# EasyEDA Pro project 51-mcu-core-board.epro

# Schematic 51单片机核心板原理图
Board Name: 51单片机核心板; Create Date: 2025-06-16; Page Name: P1; Project Name: 51单片机核心板; Schematic Name: 51单片机核心板原理图; Update Date: 2025-06-17; Company: 嘉立创EDA; Page Size: A4; Version: V1.0
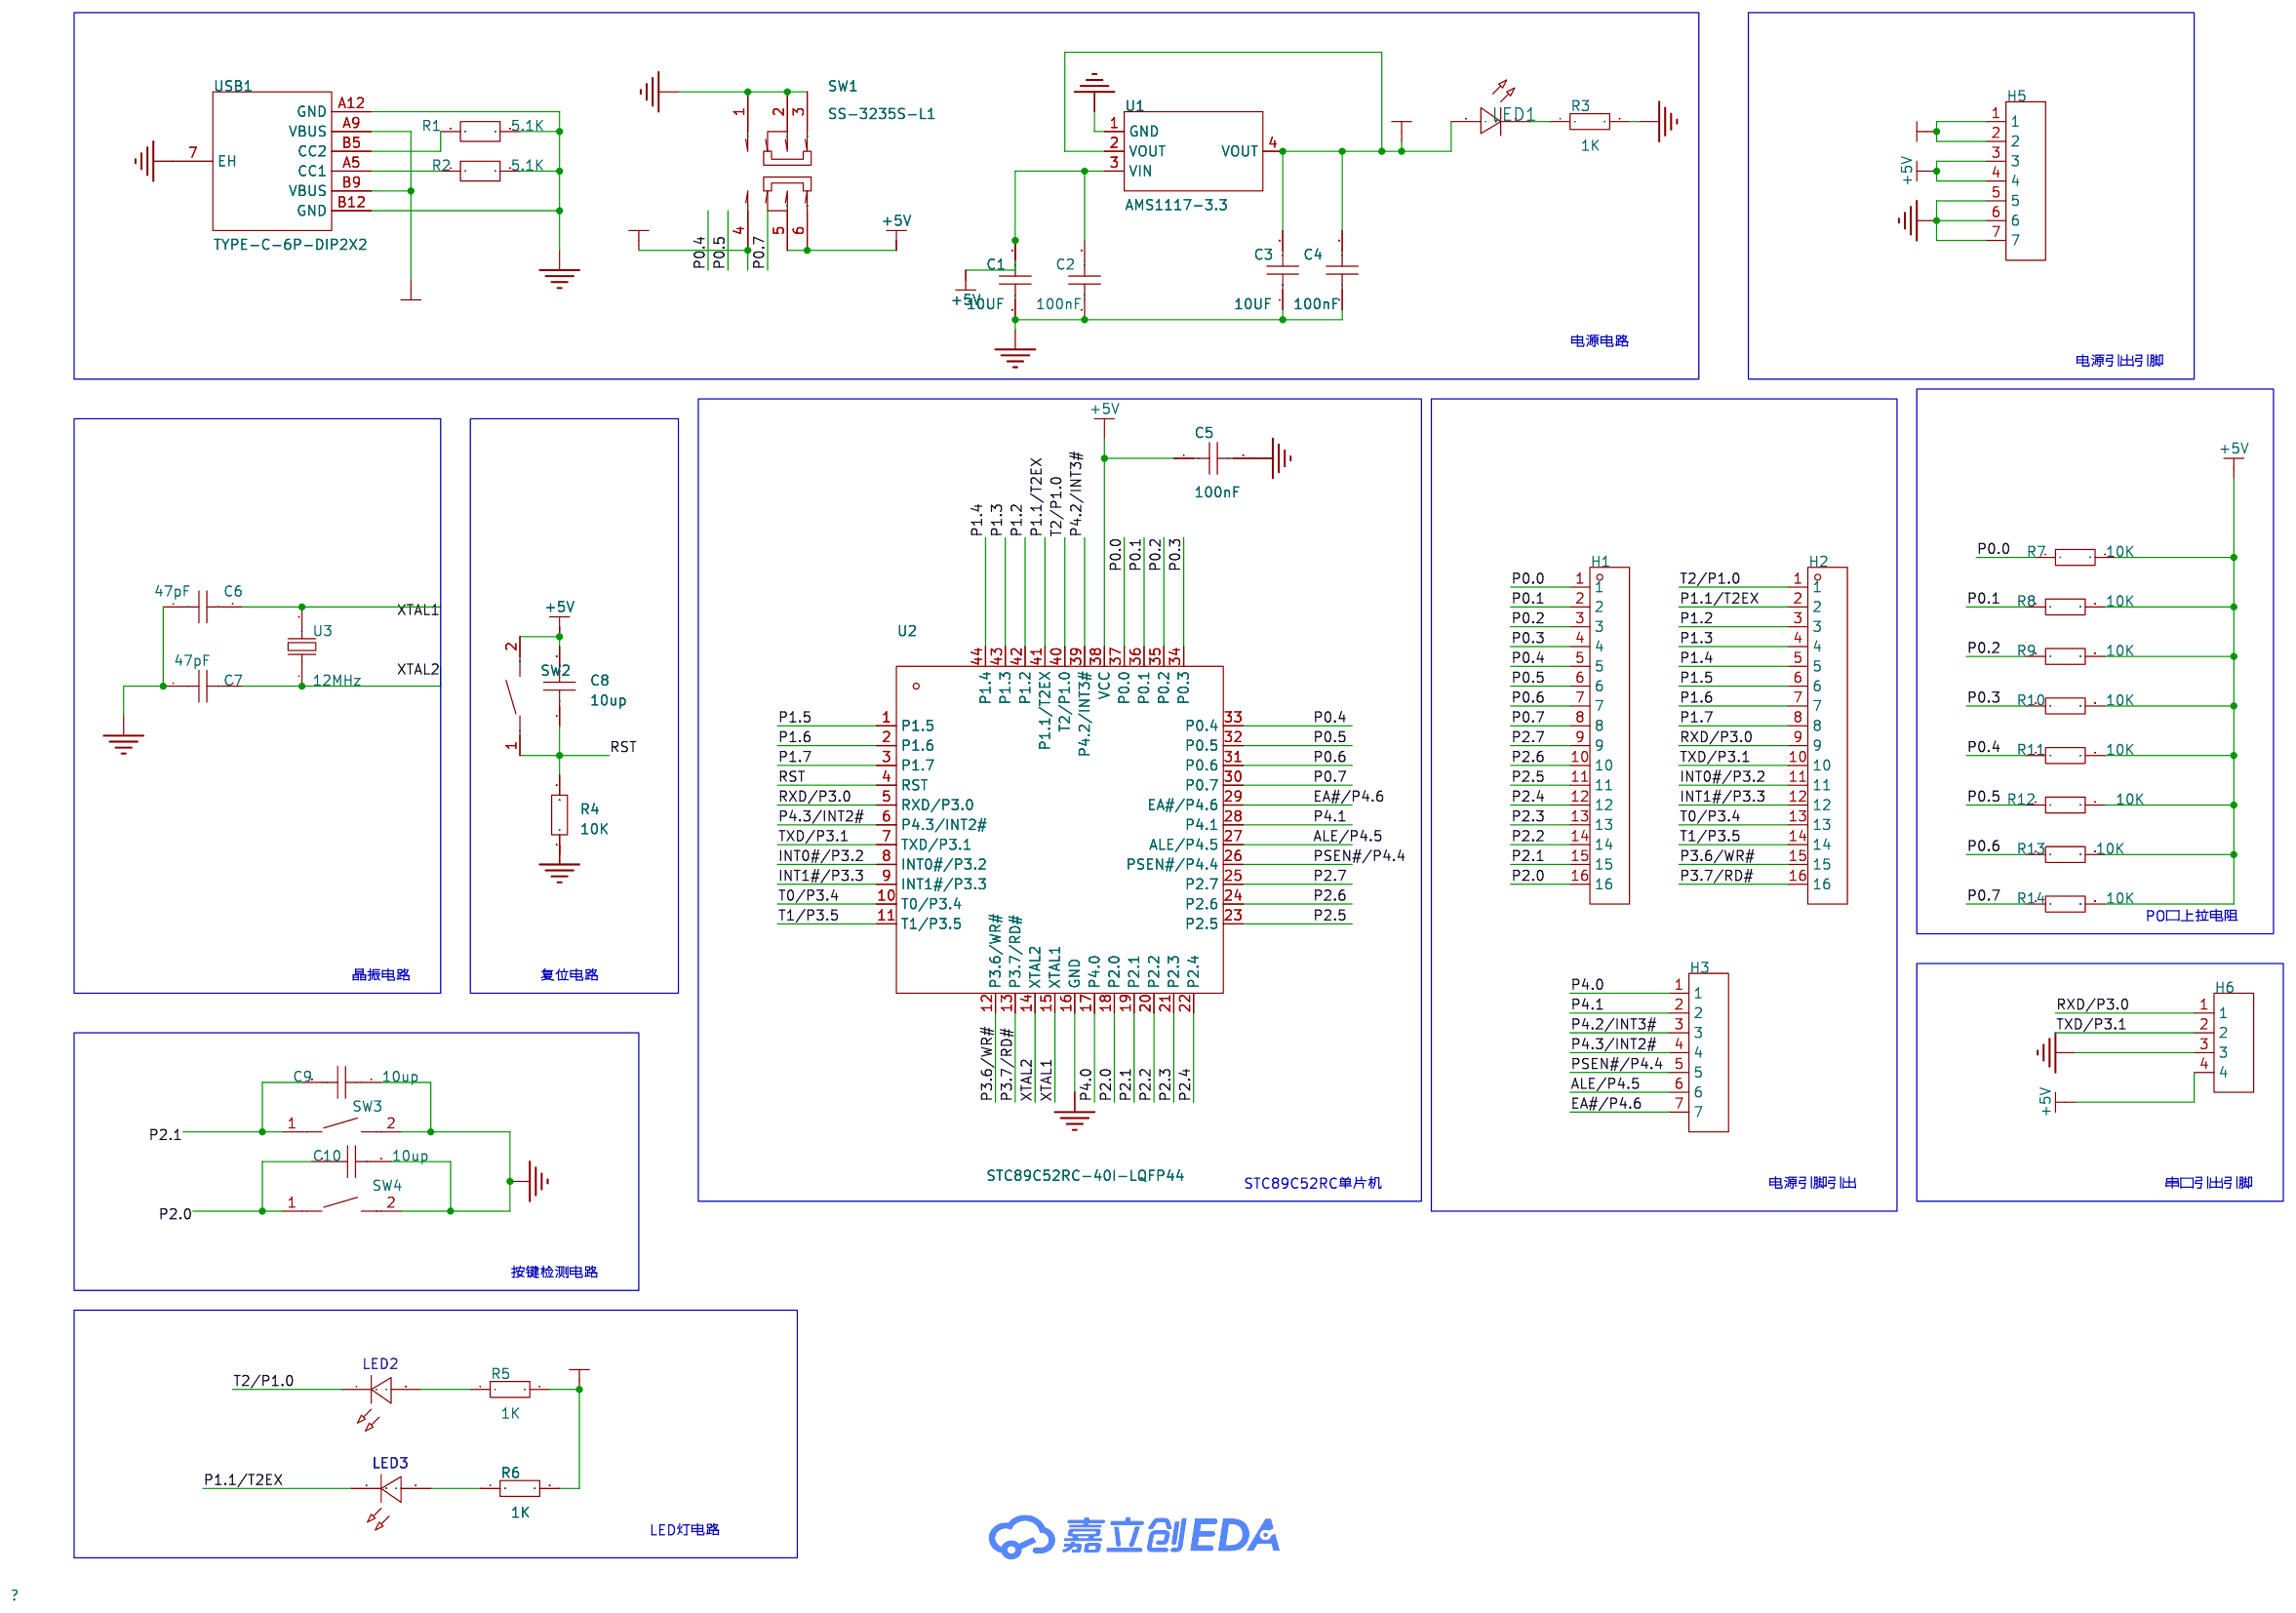
[diagram p0: schematic sheet]

## Parts
C1  10UF  [C0805]
C2  100nF  [C0805]
C3  10UF  [C0805]
C4  100nF  [C0805]
C5  100nF  [C0805]
C6  47pF  [C0805]
C7  47pF  [C0805]
C8  10up  [C0805]
C9  10up  [C0805]
C10  10up  [C0805]
H1  -  [HDR-TH_16P-P2.54-V-M]
H2  -  [HDR-TH_16P-P2.54-V-M]
H3  -  [HDR-TH_7P-P2.54-V-M]
H5  -  [HDR-TH_7P-P2.54-V-M]
H6  -  [HDR-TH_4P-P2.54-V-M]
LED1  -  [LED_0603]
LED2  -  [LED_0805]
LED3  -  [LED_0805]
R1  5.1K  [R0805]
R2  5.1K  [R0805]
R3  1K  [R0603]
R4  10K  [R0805]
R5  1K  [R0603]
R6  1K  [R0603]
R7  10K  [R0603]
R8  10K  [R0603]
R9  10K  [R0603]
R10  10K  [R0603]
R11  10K  [R0603]
R12  10K  [R0603]
R13  10K  [R0603]
R14  10K  [R0603]
SW1  SS-3235S-L1  [SW-SMD_SS-3235S-LX]
SW2  轻触按键3*4*H  [SW-SMD_L4.0-W2.9-LS5.0]
SW3  轻触按键3*4*H  [SW-SMD_L4.0-W2.9-LS5.0]
SW4  轻触按键3*4*H  [SW-SMD_L4.0-W2.9-LS5.0]
U1  AMS1117-3.3  [SOT-223-3_L6.5-W3.4-P2.30-LS7.0-BR]
U2  STC89C52RC-40I-LQFP44  [LQFP-44_L10.0-W10.0-P0.80-LS12.0-BL]
U3  12MHz  [CRYSTAL-SMD_L11.4-W4.8-LS12.7]
USB1  TYPE-C-6P-DIP2X2  [TYPE-C-SMD_TYPE-C-6P]

## Library data of the parts
C1-C10 = CAP_0805: Supplier Footprint: 0805
H1 H2 = HDR-M_2.54_1x16P: 间距:2.54mm;总PIN位数:16;排数:1;插针结构:1x16P;行距:-;安装类型:直插;圆针/方针:方针;额定电流:3A;额定电压:-;配合针长度:6mm;塑高:2.5mm;端接针长度:3mm;触头材质:-;工作温度范围:-40℃~+105℃;颜色:黑色;; Supplier Part: C2894939; Supplier Footprint: 插件
H3 H5 = HDR-M_2.54_1x7P: Supplier Part: C492406; Supplier Footprint: 插件
H6 = HDR-M_2.54_1x4P: Supplier Part: C492403; Supplier Footprint: 插件
LED1 = LED_0603-R: Supplier Footprint: 0603
LED2 LED3 = LED_0805-G: Supplier Footprint: 0805
R1 R2 = FRC0805F1005TS: 电阻类型:厚膜电阻;阻值:10MΩ;精度:±1%;功率:125mW;工作电压:150V;温度系数:±100ppm/℃;; LCSC Part Name: 10MΩ ±1% 125mW 厚膜电阻; Supplier Part: C2933281; Manufacturer: FOJAN(富捷); Supplier Footprint: 0805; Datasheet: https://atta.szlcsc.com/upload/public/pdf/source/20211221/925EC7D7225764EE0046F22065062C87.pdf; Supplier: LCSC; Type: 厚膜电阻; Tolerance: ±1%; Power(Watts): 125mW; Voltage-Supply(Max): 150V; Temperature Coefficient: ±100ppm/℃; Operating Temperature: -55℃~+155℃
R3 R5-R14 = Res_0603: Supplier Footprint: 0603
R4 = Res_0805: Supplier Footprint: 0805
SW1 = SS-3235S-L1: 电路结构:双刀双掷;安装方式:卧贴;开关颜色:黑色;额定电流(DC):50mA;额定电压(DC):12V;额定电流(AC):50mA;额定电压(AC):12V;机械寿命:1万次;; LCSC Part Name: 柄长2mm 卧贴双档 滑动开关; Supplier Part: C500055; Manufacturer: XKB Connectivity(中国星坤); Supplier Footprint: SMD; JLCPCB Part Class: 扩展库; Datasheet: https://atta.szlcsc.com/upload/public/pdf/source/20211011/39D516E750C13BE9339464E723D9F132.pdf; Supplier: LCSC; Circuit: 双刀双掷; Actuator Style: 矩形柱状; Pin Style: 鸥翼型; Switch Length: 9.1mm; Switch Width: 3.55mm; Switch Height: 3.2mm; Mounting Style: 卧贴; Actuator Color: 黑色; Current Rating (DC): 50mA; Voltage Rating (DC): 12V; Current Rating (AC): 50mA; Voltage Rating (AC): 12V; Mechanical Life: 1万次; Operating Temperature: -40℃~+85℃
SW2-SW4 = 轻触按键3*4*H: Supplier Part: C9900017573; Supplier Footprint: 轻触按键3*4*2.5; JLCPCB Part Class: 扩展库; Supplier: LCSC
U1 = AMS1117-3.3_C6186: 输出类型:固定;工作电压:16V;输出电压:3.3V;输出电流:1A;电源纹波抑制比(PSRR):72dB@(120Hz);输出极性:正极;; LCSC Part Name: 输出3.3V 1A; Supplier Part: C6186; Manufacturer: AMS; Supplier Footprint: SOT-223; JLCPCB Part Class: 基础库; Datasheet: https://atta.szlcsc.com/upload/public/pdf/source/20180727/C6186_7A095716F0823C02F1997A905E26C086.pdf; Supplier: LCSC; Output Type: 固定; Voltage - Supply: 16V; Output Voltage: 3.3V; Output Current: 1A; Power Supply Rejection Ratio (PSRR): 72dB@(120Hz); Voltage Dropout: 1.1V@(800mA); standby current: 5mA; Features: 过流保护；过热保护; Operating Temperature: -40℃~+125℃; Output Configuration: 正极; Number of Outputs: 1
U2 = STC89C52RC-40I-LQFP44: CPU内核:51系列;应用领域:-;; Supplier Part: C8707; Manufacturer: STC; Supplier Footprint: LQFP-44(10x10); JLCPCB Part Class: 扩展库; Datasheet: https://atta.szlcsc.com/upload/public/pdf/source/20241226/242305099CBBF4767F79975207B2F263.pdf; Supplier: LCSC; CPU Core: 51系列; Program Storage Size: 8KB; Program Memory Type: FLASH; Number of I/O: 39; Low Voltage Detection Threshold: 3.3V~5.5V
U3 = ECS-120-32-5PXDU-TR: 频率:12MHz;常温频差:±30ppm;外接负载电容:32pF;频率稳定度(全温):±100ppm;; LCSC Part Name: 12MHz ±30ppm 32pF; Supplier Part: C2450010; Manufacturer: ECS; Supplier Footprint: HC-49US; JLCPCB Part Class: 扩展库; Datasheet: https://atta.szlcsc.com/upload/public/pdf/source/20210607/6CE2B19D645C2A007ECD54C2AAD63643.pdf; Supplier: LCSC; Normal temperature Frequency Tolerance: ±30ppm; External load capacitor: 32pF; Frequency Stability(Full temperature range): ±100ppm; Equivalent Series Resistance (ESR): 50Ω; Operating Temperature: -55℃~+125℃
USB1 = TYPE-C-6P-DIP2X2: Supplier Part: C9900017627; Supplier Footprint: TYPE-C-6P; JLCPCB Part Class: 扩展库; Supplier: LCSC

## Nets
3.3V: C3.2 C4.2 H5.1 H5.2 LED1.2(A) R5.2 R6.2 U1.2(VOUT) U1.4(VOUT)
+5V: C1.2 C2.2 C5.1 C8.2 H5.3 H5.4 H6.4 R7.2 R8.2 R9.2 R10.2 R11.2 R12.2 R13.2 R14.2 SW1.5 SW1.6 SW2.2 U1.3(VIN) U2.38(VCC)
GND: C1.1 C2.1 C3.1 C4.1 C5.2 C6.1 C7.1 C9.1 C10.1 H5.5 H5.6 H5.7 H6.3 R1.2 R2.2 R3.2 R4.1 SW1.1 SW1.2 SW1.3 SW3.2 SW4.2 U1.1(GND) U2.16(GND) USB1.7(EH) USB1.A12(GND) USB1.B12(GND)
VCC+5V: SW1.4 USB1.A9(VBUS) USB1.B9(VBUS)
ALE/P4.5: H3.6 U2.27(ALE/P4.5)
EA#/P4.6: H3.7 U2.29(EA#/P4.6)
INT0#/P3.2: H2.11 U2.8(INT0#/P3.2)
INT1#/P3.3: H2.12 U2.9(INT1#/P3.3)
P0.0: H1.1 R7.1 U2.37(P0.0)
P0.1: H1.2 R8.1 U2.36(P0.1)
P0.2: H1.3 R9.1 U2.35(P0.2)
P0.3: H1.4 R10.1 U2.34(P0.3)
P0.4: H1.5 R11.1 U2.33(P0.4)
P0.5: H1.6 R12.1 U2.32(P0.5)
P0.6: H1.7 R13.1 U2.31(P0.6)
P0.7: H1.8 R14.1 U2.30(P0.7)
P1.1/T2EX: H2.2 LED3.1(C) U2.41(P1.1/T2EX)
P1.2: H2.3 U2.42(P1.2)
P1.3: H2.4 U2.43(P1.3)
P1.4: H2.5 U2.44(P1.4)
P1.5: H2.6 U2.1(P1.5)
P1.6: H2.7 U2.2(P1.6)
P1.7: H2.8 U2.3(P1.7)
P2.0: C10.2 H1.16 SW4.1 U2.18(P2.0)
P2.1: C9.2 H1.15 SW3.1 U2.19(P2.1)
P2.2: H1.14 U2.20(P2.2)
P2.3: H1.13 U2.21(P2.3)
P2.4: H1.12 U2.22(P2.4)
P2.5: H1.11 U2.23(P2.5)
P2.6: H1.10 U2.24(P2.6)
P2.7: H1.9 U2.25(P2.7)
P3.6/WR#: H2.15 U2.12(P3.6/WR#)
P3.7/RD#: H2.16 U2.13(P3.7/RD#)
P4.0: H3.1 U2.17(P4.0)
P4.1: H3.2 U2.28(P4.1)
P4.2/INT3#: H3.3 U2.39(P4.2/INT3#)
P4.3/INT2#: H3.4 U2.6(P4.3/INT2#)
PSEN#/P4.4: H3.5 U2.26(PSEN#/P4.4)
RST: C8.1 R4.2 SW2.1 U2.4(RST)
RXD/P3.0: H2.9 H6.1 U2.5(RXD/P3.0)
T0/P3.4: H2.13 U2.10(T0/P3.4)
T1/P3.5: H2.14 U2.11(T1/P3.5)
T2/P1.0: H2.1 LED2.1(C) U2.40(T2/P1.0)
TXD/P3.1: H2.10 H6.2 U2.7(TXD/P3.1)
XTAL1: C6.2 U2.15(XTAL1) U3.2
XTAL2: C7.2 U2.14(XTAL2) U3.1
$1N266: R1.1 USB1.B5(CC2)
$1N271: R2.1 USB1.A5(CC1)
$1N1197: LED1.1(C) R3.1
$1N4768: LED2.2(A) R5.1
$1N4814: LED3.2(A) R6.1

## Notes on the sheet
- 电源电路
- 电源引出引脚
- PO口上拉电阻
- 晶振电路
- 复位电路
- STC89C52RC单片机
- 电源引脚引出
- 串口引出引脚
- 按键检测电路
- LED灯电路

# Board 51单片机核心板PCB
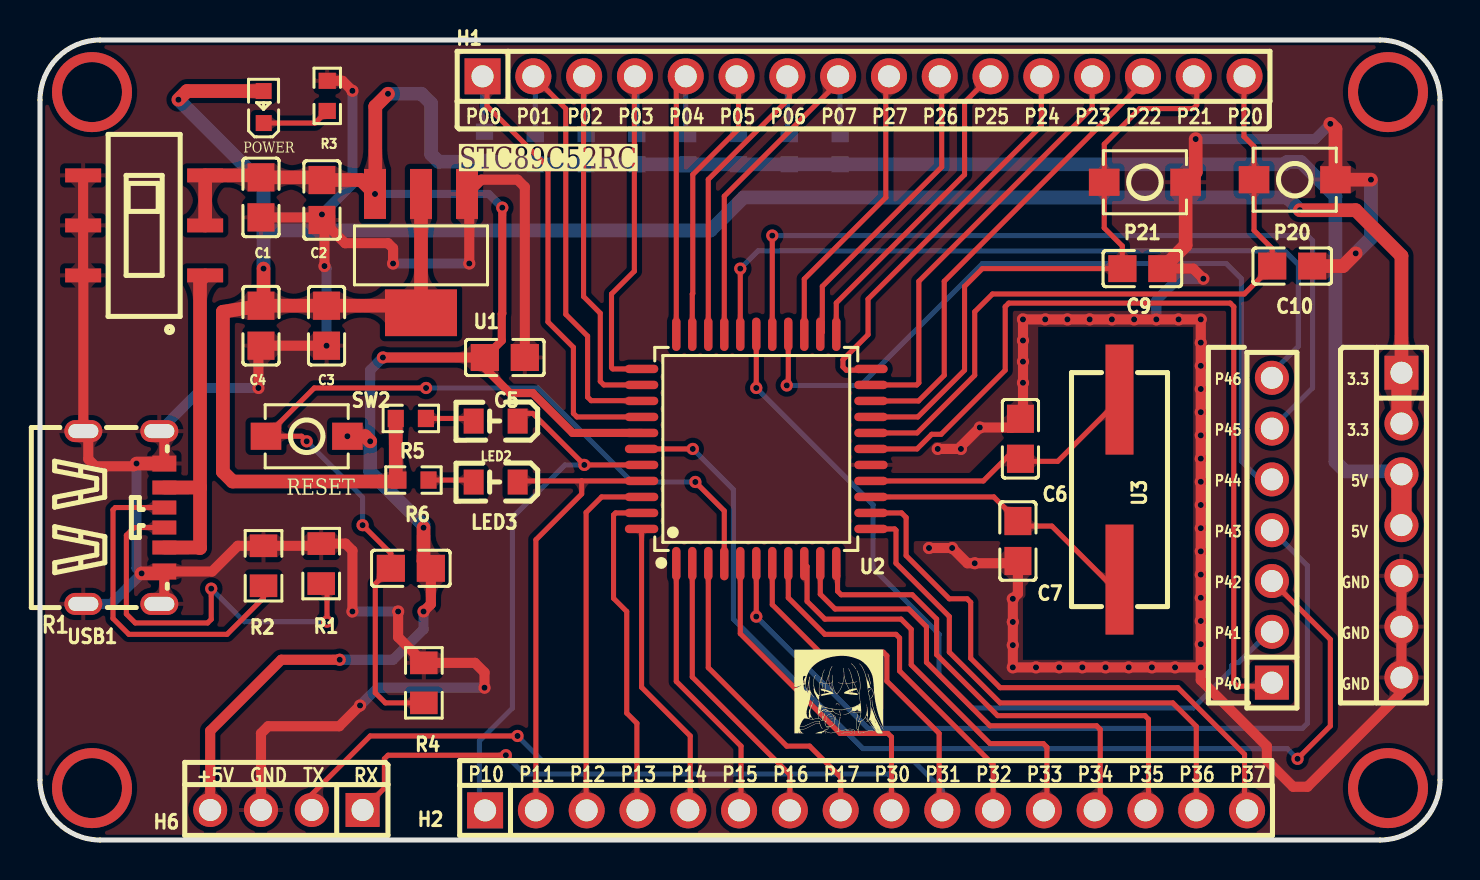
[diagram p1: board, top side]
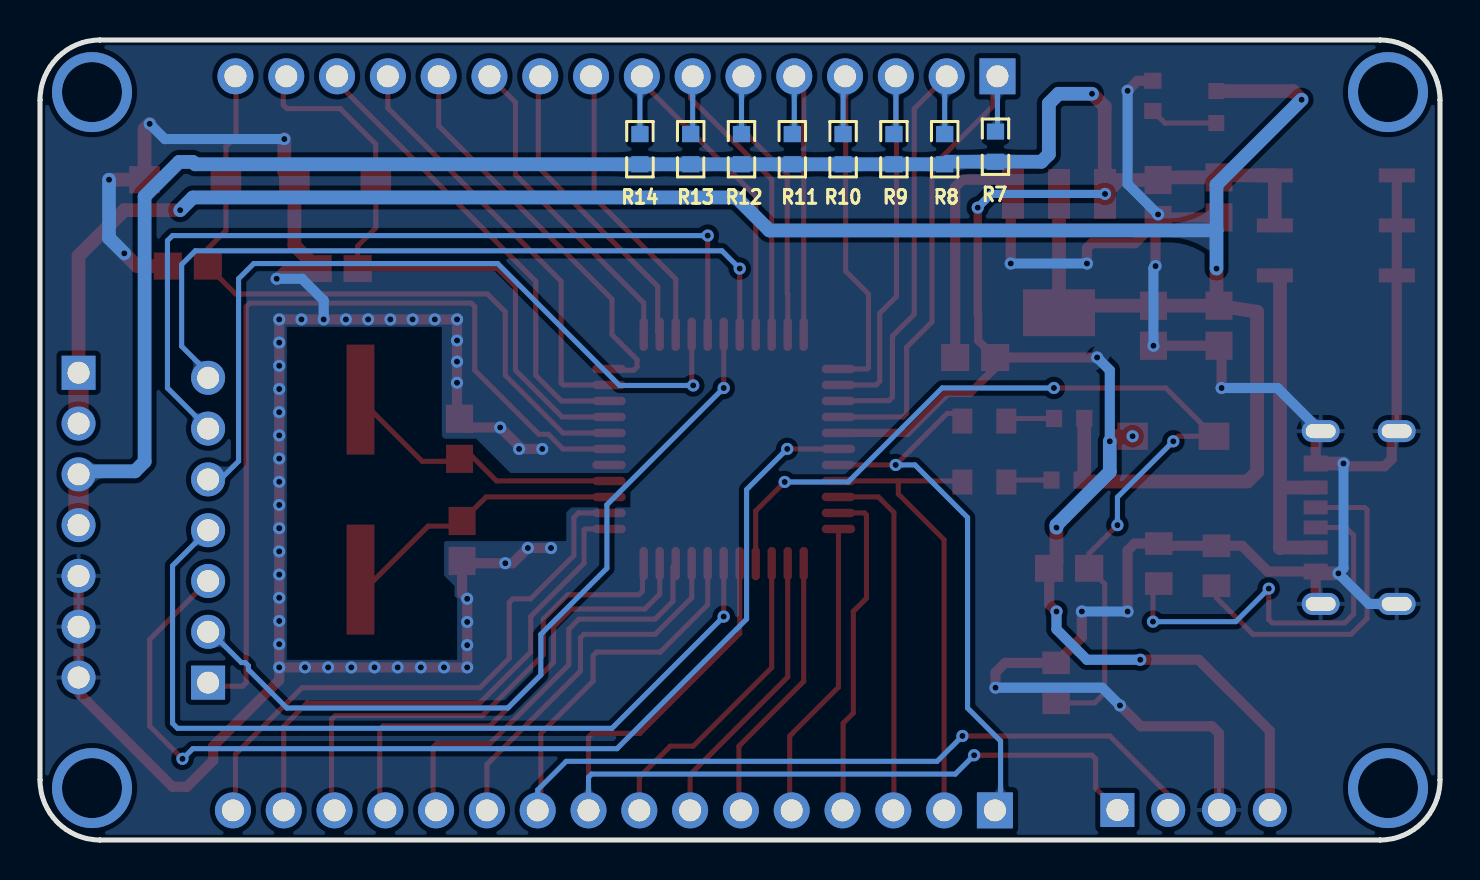
[diagram p2: board, bottom side, seen from below]

Outline 70 x 40 mm; copper layers: Top Layer, Bottom Layer. Coordinates in mm from the lower left corner of the outline.
Outline path: 0,37 0,3 arc(0.88,0.88) 3,0 67,0 arc(69.12,0.88) 70,3 70,37 arc(69.12,39.12) 67,40 3,40 arc(0.88,39.12) 0,37
Stack: Top Layer 0.035mm / Dielectric1 1.51mm FR4 er 4.5 / Bottom Layer 0.035mm

## Design rules (mm)
net XTAL1: DP1
net XTAL2: DP1
template: JLCPCB Capability(Two Layers Board)
spacing copperThickness1oz (default): track to track 0.102, other pairs 0.152 to 0.3
spacing copperThickness2oz: track to track 0.203, other pairs 0.152 to 0.3
track width copperThickness1oz (default): min 0.127, default 0.254, max 2.54
track width copperThickness2oz: min 0.203, default 0.254, max 2.54
differential pair differentialPair (default): width min 0.127, default 0.254, max 2.54; gap min 0.152, default 0.152
via viaSize (default): diameter min 0.5, default 0.61, max 10; hole min 0.3, default 0.305, max 6.3

## Placement (name value [footprint] x y rotation side)
C1  10UF  [C0805]  11.05 32.13 90 top
C2  100nF  [C0805]  14.1 32 90 top
C3  10UF  [C0805]  14.33 25.71 90 top
C4  100nF  [C0805]  11.05 25.72 90 top
C5  100nF  [C0805]  23.24 24.12 0 top
C6  47pF  [C0805]  49.02 20.06 270 top
C7  47pF  [C0805]  48.9 14.95 90 top
C8  10up  [C0805]  18.54 13.58 0 top
C9  10up  [C0805]  55.12 28.57 180 top
C10  10up  [C0805]  62.61 28.7 180 top
H1  -  [HDR-TH_16P-P2.54-V-M]  41.18 38.18 0 top
H2  -  [HDR-TH_16P-P2.54-V-M]  41.3 1.48 0 top
H3  -  [HDR-TH_7P-P2.54-V-M]  61.59 15.49 90 top
H5  -  [HDR-TH_7P-P2.54-V-M]  68.07 15.74 270 top
H6  -  [HDR-TH_4P-P2.54-V-M]  12.32 1.5 180 top
LED1  -  [LED_0603]  11.18 36.7 90 top
LED2  -  [LED_0805]  22.73 20.95 180 top
LED3  -  [LED_0805]  22.73 17.9 180 top
P20  轻触按键3*4*H  [SW-SMD_L4.0-W2.9-LS5.0]  62.74 33.02 0 top
P21  轻触按键3*4*H  [SW-SMD_L4.0-W2.9-LS5.0]  55.25 32.89 0 top
R1  5.1K  [R0805]  14.06 13.82 90 top
R2  5.1K  [R0805]  11.18 13.71 90 top
R3  1K  [R0603]  14.36 37.21 90 top
R4  10K  [R0805]  19.19 7.86 270 top
R5  1K  [R0603]  18.54 21.08 180 top
R6  1K  [R0603]  18.67 18 180 top
R7  10K  [R0603]  22.22 34.67 270 bottom
R8  10K  [R0603]  24.76 34.54 270 bottom
R9  10K  [R0603]  27.31 34.54 270 bottom
R10  10K  [R0603]  29.84 34.54 270 bottom
R11  10K  [R0603]  32.38 34.54 270 bottom
R12  10K  [R0603]  34.93 34.54 270 bottom
R13  10K  [R0603]  37.47 34.54 270 bottom
R14  10K  [R0603]  40 34.54 270 bottom
SW1  SS-3235S-L1  [SW-SMD_SS-3235S-LX]  5.21 30.73 90 top
SW2  轻触按键3*4*H  [SW-SMD_L4.0-W2.9-LS5.0]  13.33 20.19 0 top
U1  AMS1117-3.3  [SOT-223-3_L6.5-W3.4-P2.30-LS7.0-BR]  19.05 29.33 90 top
U2  STC89C52RC-40I-LQFP44  [LQFP-44_L10.0-W10.0-P0.80-LS12.0-BL]  35.81 19.55 0 top
U3  12MHz  [CRYSTAL-SMD_L11.4-W4.8-LS12.7]  53.97 17.52 90 top
USB1  TYPE-C-6P-DIP2X2  [TYPE-C-SMD_TYPE-C-6P]  4.19 16.12 270 top

## Footprints (pads in the part's own frame, mm; a bottom-side part is the same pattern mirrored in y, then rotated)
C0805
  rect 1.41x1.35 smd: 1(-1,0) 2(1,0)
CRYSTAL-SMD_L11.4-W4.8-LS12.7
  rect 5.5x1.4 smd: 1(-4.5,0) 2(4.5,0)
HDR-TH_4P-P2.54-V-M
  rect 1.7x1.7 hole 1.1: 1(-3.81,0)
  round 1.7 hole 1.1: 2(-1.27,0) 3(1.27,0) 4(3.81,0)
HDR-TH_7P-P2.54-V-M
  rect 1.7x1.7 hole 1.1: 1(-7.62,0)
  round 1.7 hole 1.1: 2(-5.08,0) 3(-2.54,0) 4(0,0) 5(2.54,0) 6(5.08,0) 7(7.62,0)
HDR-TH_16P-P2.54-V-M
  rect 1.8x1.8 hole 1.1: 1(-19.05,0)
  round 1.8 hole 1.1: 2(-16.51,0) 3(-13.97,0) 4(-11.43,0) 5(-8.89,0) 6(-6.35,0) 7(-3.81,0) 8(-1.27,0) 9(1.27,0) 10(3.81,0) 11(6.35,0) 12(8.89,0) 13(11.43,0) 14(13.97,0) 15(16.51,0) 16(19.05,0)
LED_0603
  rect 0.8x0.8 smd: 1(-0.851,-0.01) 2(0.75,-0.005)
LED_0805
  rect 1x1.25 smd: 1(-1.15,0.005) 2(1.05,0.005)
LQFP-44_L10.0-W10.0-P0.80-LS12.0-BL
  oval 0.42x1.67 smd: 1(-4,-5.735) 2(-3.2,-5.735) 3(-2.4,-5.735) 4(-1.6,-5.735) 5(-0.8,-5.735) 6(0,-5.735) 7(0.8,-5.735) 8(1.6,-5.735) 9(2.4,-5.735) 10(3.2,-5.735) 11(4,-5.735) 23(4,5.735) 24(3.2,5.735) 25(2.4,5.735) 26(1.6,5.735) 27(0.8,5.735) 28(0,5.735) 29(-0.8,5.735) 30(-1.6,5.735) 31(-2.4,5.735) 32(-3.2,5.735) 33(-4,5.735)
  oval 1.67x0.42 smd: 12(5.735,-4) 13(5.735,-3.2) 14(5.735,-2.4) 15(5.735,-1.6) 16(5.735,-0.8) 17(5.735,0) 18(5.735,0.8) 19(5.735,1.6) 20(5.735,2.4) 21(5.735,3.2) 22(5.735,4) 34(-5.735,4) 35(-5.735,3.2) 36(-5.735,2.4) 37(-5.735,1.6) 38(-5.735,0.8) 39(-5.735,0) 40(-5.735,-0.8) 41(-5.735,-1.6) 42(-5.735,-2.4) 43(-5.735,-3.2) 44(-5.735,-4)
R0603
  rect 0.806x0.864 smd: 1(-0.753,0) 2(0.753,0)
R0805
  rect 1.133x1.377 smd: 1(-1,0) 2(1,0)
SOT-223-3_L6.5-W3.4-P2.30-LS7.0-BR
  rect 2.5x1.1 smd: 1(2.97,-2.3) 2(2.97,0) 3(2.97,2.3)
  rect 2.34x3.6 smd: 4(-2.97,0)
SW-SMD_L4.0-W2.9-LS5.0
  rect 1.53x1.36 smd: 1(-2.035,0) 2(2.035,0)
SW-SMD_SS-3235S-LX
  rect 0.7x1.8 smd: 1(-2.5,3.05) 2(0,3.05) 3(2.5,3.05) 4(-2.5,-3.05) 5(0,-3.05) 6(2.5,-3.05)
TYPE-C-SMD_TYPE-C-6P
  oval 1.1x1.9 hole 0.7x1.5: 7(-4.32,1.775) 7(-4.32,-2.025) 7(4.32,1.775) 7(4.32,-2.025)
  rect 0.7x1.2 smd: A5(-0.5,2.025) A9(1.5,2.025) B5(0.5,2.025) B9(-1.5,2.025)
  rect 0.8x1.2 smd: A12(2.7,2.025) B12(-2.7,2.025)

## Nets
As in the schematic, except:
GND: C1.1 C2.1 C3.1 C4.1 C5.2 C6.1 C7.1 C9.1 C10.1 H5.5 H5.6 H5.7 H6.3 P20.2 P21.2 R1.2 R2.2 R3.2 R4.1 SW1.1 SW1.2 SW1.3 U1.1 U2.16 USB1.7 USB1.A12 USB1.B12
P2.0: C10.2 H1.16 P20.1 U2.18
P2.1: C9.2 H1.15 P21.1 U2.19

## Via types
v1: diameter 4, hole 3, Top Layer to Bottom Layer, 4 vias
v2: diameter 0.61, hole 0.305, Top Layer to Bottom Layer, 90 vias

## Routing (per net, layer and track width the routed paths; a pad name or vN(x,y) marks a point on that pad's centre or on a via; arc(x,y) is an arc through that point)
3.3V: length 119.9
  Top Layer w0.686: U1.2 U1.4 18.7,26.71 C3.2 11.05,26.71 C4.2 ; C4.2 9.14,26.41 9.14,18.41 9.63,17.93 17.85,17.93 R6.2 17.79,18.13 R5.2 ; C4.2 11.18,26.84 v2(11.18,28.57) ; LED1.2 7.35,37.45 v2(6.92,37.02) ; v2(62.99,31.49) 65.79,31.49 68.07,29.2 H5.1
  Top Layer w1.016: H5.1 H5.2
  Bottom Layer w0.686: v2(62.99,31.49) 62.36,32.13 35.18,32.13 33.53,30.48 11.18,30.48 ; 11.18,30.48 v2(11.18,28.57) ; 11.18,30.48 11.18,32.76 v2(6.92,37.02)
+5V: length 149.6
  Top Layer w0.406: v2(23.11,31.62) 23.11,26.33 23.09,26.3 23.09,24.97 C5.1 22.24,23.6 23.5,22.35 24.64,22.35 26.63,20.35 30.08,20.35
  Top Layer w0.508: C5.1 v2(17.14,24.12) ; v2(19.18,11.43) 19.54,11.79 C8.2 ; v2(14.99,9.01) 12.06,9.01 8.51,5.46 H6.4
  Top Layer w0.686: C8.2 19.18,13.95 v2(19.18,15.62) ; v2(17.4,37.31) 16.76,36.68 16.76,32.32 v2(16.75,32.3) 16.05,33 C2.2 13.97,33.13 C1.2 10.95,33.23 SW1.6 SW1.5 ; v2(15.37,20.19) 16.26,20.19 v2(16.51,19.93)
  Top Layer w1.016: H5.3 H5.4
  Bottom Layer w0.406: v2(23.11,31.62) 22.43,32.3 v2(16.75,32.3)
  Bottom Layer w0.508: v2(19.18,11.43) 19.18,10.54 17.65,9.01 v2(14.99,9.01) ; v2(17.14,24.12) 16.51,23.49 v2(16.51,19.93)
  Bottom Layer w0.686: v2(17.4,37.31) 19.07,37.31 19.56,36.83 19.56,34.29 19.93,33.91 R7.2 24.64,33.91 R8.2 R9.2 R10.2 R11.2 R12.2 R13.2 R14.2 62.24,33.79 62.36,33.9 63.04,33.9 64.77,32.18 64.77,18.92 65.25,18.43 67.92,18.43 H5.3 ; v2(16.51,19.93) 16.51,18.41 19.18,15.74 v2(19.18,15.62)
GND: length 231.7
  Top Layer w0.508: 14.22,30.87 15.26,29.84 17.4,29.84 17.65,29.59 v2(17.65,28.82) ; 14.22,30.87 C2.1 13.97,31.13 C1.1 ; 14.22,30.87 v2(14.22,28.7) ; v2(58.04,8.63) v2(56.75,8.63) v2(55.59,8.63) v2(54.44,8.63) v2(53.28,8.63) v2(52.12,8.63) v2(50.96,8.63) v2(49.8,8.63) v2(48.64,8.63) v2(48.64,9.74) v2(48.64,10.9) v2(48.64,12.06) 48.9,12.31 C7.1 48.78,13.84 v2(46.74,13.84) 46.37,13.84 v2(45.61,14.6) v2(44.45,14.6) ; v2(58.04,8.63) v2(58.04,9.79) v2(58.04,10.95) v2(58.04,12.11) v2(58.04,13.27) v2(58.04,14.43) v2(58.04,15.59) v2(58.04,16.75) v2(58.04,17.91) v2(58.04,19.07) v2(58.04,20.23) v2(58.04,21.39) v2(58.04,22.55) v2(58.04,23.71) v2(58.04,24.87) v2(58.04,26.03) v2(56.93,26.03) v2(55.82,26.03) v2(54.71,26.03) v2(53.59,26.03) v2(52.48,26.03) v2(51.37,26.03) v2(50.26,26.03) v2(49.15,26.03) v2(49.15,24.97) v2(49.15,23.92) v2(49.15,22.86) 49.15,21.19 C6.1 48.59,20.62 v2(46.99,20.62) 46.04,19.68 v2(46.04,19.55) v2(44.89,19.55) ; v2(58.04,8.63) 58.04,8 61.34,4.69 61.34,3.98 62.65,2.66 63.37,2.66 68.07,7.36 H5.7 H5.6 H5.5 ; 6.22,18.82 6.22,20.19 5.97,20.44 ; C5.2 24.24,32.65 23.88,33.02 22.06,33.02 U1.1 21.46,32.19 v2(21.46,28.82) ; v2(14.33,24.71) 14.33,24.72 C4.1 10.92,24.59 v2(10.92,22.6) ; R3.2 15.12,37.96 v2(15.62,37.46) ; v2(16,6.73) 14.96,5.69 11.41,5.69 11.05,5.33 H6.3 ; v2(58.17,28.06) 57.66,28.57 C9.1 ; v2(22.22,7.62) 22.22,8.38 21.75,8.86 R4.1 17.91,10.14 v2(17.91,11.43) ; v2(15.62,11.43) 15.62,14.47 15.27,14.82 R1.2 13.95,14.71 R2.2 9.89,14.71 8.6,13.42 USB1.A12 6.22,12.05 USB1.7 ; v2(4.83,18.82) 4.69,18.69 2.77,18.69 2.41,19.05 2.41,20.2 2.17,20.44 2.17,28.22 SW1.1 SW1.2 SW1.3
  Top Layer w0.686: v2(5.08,13.33) 6.12,13.33 USB1.A12 ; C10.1 65.15,28.7 v2(65.79,29.33) ; v2(57.78,35.05) 57.78,33.39 P21.2 57.28,29.73 C9.1 ; 6.22,18.82 v2(4.83,18.82) ; v2(66.55,33.02) P20.2 64.77,35.55 v2(64.52,35.81)
  Bottom Layer w0.508: v2(14.1,31.28) 15.62,32.8 v2(15.62,37.46) ; v2(14.22,28.7) 14.33,28.59 v2(14.33,24.71) ; v2(15.62,11.43) v2(17.91,11.43) ; v2(10.92,22.6) 8.12,22.6 5.97,20.44 ; v2(22.22,7.62) 16.89,7.62 v2(16,6.73) ; v2(64.52,35.81) 63.75,35.05 v2(57.78,35.05) ; v2(55.82,26.03) 55.82,26.98 56.9,28.06 v2(58.17,28.06) ; v2(17.65,28.82) v2(21.46,28.82) ; v2(4.83,18.82) 4.83,13.58 v2(5.08,13.33) 3.55,11.8 USB1.7
  Bottom Layer w0.686: v2(65.79,29.33) 66.55,30.09 v2(66.55,33.02)
VCC+5V: length 17.3
  Top Layer w0.686: SW1.4 8,27.97 8,17.62 ; 8,17.62 8,14.6 7.98,14.62 USB1.A9 ; 8,17.62 USB1.B9
(no net):
  vias: v1(2.6,37.4) v1(2.6,2.59) v1(67.4,37.4) v1(67.4,2.59)
ALE/P4.5: length 42.3
  Top Layer w0.254: U2.27 v2(36.61,30.22)
  Bottom Layer w0.254: v2(36.61,30.22) 63.37,30.22 63.63,29.97 63.63,22.6 H3.6
EA#/P4.6: length 38
  Top Layer w0.254: U2.29 v2(35.01,28.57)
  Bottom Layer w0.254: v2(35.01,28.57) 35.9,29.46 62.23,29.46 62.92,28.77 62.92,24.69 61.59,23.36 H3.7
INT0#/P3.2: length 18.7
  Top Layer w0.254: U2.8 37.41,12.11 39.24,10.28 42.8,10.28 42.98,10.1 42.98,8.45 47.65,3.78 H2.11
INT1#/P3.3: length 21.2
  Top Layer w0.254: U2.9 38.35,13.68 38.35,11.93 39.24,11.04 43.05,11.04 43.56,10.54 43.56,8.76 47.5,4.82 50.16,4.82 50.34,4.64 50.34,1.63 H2.12
P0.0: length 25
  Top Layer w0.254: 30.08,21.15 26.85,21.15 26.67,21.33 26.67,24.63 25.4,25.9 25.4,33.65 22.35,36.7 22.35,37.96 H1.1
  Bottom Layer w0.254: H1.1 22.13,35.52 R7.1
P0.1: length 22.9
  Top Layer w0.254: 30.08,21.95 30.07,21.97 27.56,21.97 27.38,22.15 27.38,25.19 26.29,26.28 26.29,36.56 H1.2
  Bottom Layer w0.254: H1.2 24.76,38.09 R8.1
P0.2: length 20.7
  Top Layer w0.254: 30.08,22.75 28.19,22.75 28.01,22.93 28.01,26.34 27.18,27.17 27.18,38.15 H1.3
  Bottom Layer w0.254: R9.1 27.21,35.39 H1.3
P0.3: length 19.5
  Top Layer w0.254: 30.08,23.55 28.64,23.55 28.57,23.62 28.57,27.3 29.72,28.44 29.72,38.15 H1.4
  Bottom Layer w0.254: H1.4 29.84,38.09 R10.1
P0.4: length 16
  Top Layer w0.254: U2.33 31.81,37.71 H1.5
  Bottom Layer w0.254: R11.1 32.29,35.39 H1.5
P0.5: length 16.8
  Top Layer w0.254: U2.32 32.61,27.3 32.64,27.33 32.64,33.27 34.93,35.56 34.93,38.09 H1.6
  Bottom Layer w0.254: H1.6 34.93,38.09 R12.1
P0.6: length 17.5
  Top Layer w0.254: H1.7 37.47,38.09 37.47,37.08 33.41,33.03 U2.31
  Bottom Layer w0.254: R13.1 37.37,35.39 H1.7
P0.7: length 18.2
  Top Layer w0.254: H1.8 39.91,37.88 34.21,32.19 U2.30
  Bottom Layer w0.254: H1.8 40,38.09 R14.1
P1.1/T2EX: length 23.6
  Top Layer w0.254: H2.2 24.79,15.01 27.08,17.3 27.08,17.95 ; LED3.1 23.94,17.95 27.08,17.95 ; 30.08,17.95 27.08,17.95
P1.2: length 18
  Top Layer w0.254: 30.08,17.15 28.08,17.15 27.31,16.38 27.31,1.51 H2.3
P1.3: length 16.7
  Top Layer w0.254: 30.08,16.35 28.78,16.35 28.68,16.25 28.68,12.09 29.34,11.43 29.34,6.34 29.84,5.84 29.84,1.51 H2.4
P1.4: length 15.1
  Top Layer w0.254: 30.08,15.55 30.08,7.64 32.51,5.2 32.51,1.58 H2.5
P1.5: length 13.7
  Top Layer w0.254: H2.6 35.05,1.58 35.05,4.69 31.81,7.93 U2.1
P1.6: length 14.4
  Top Layer w0.254: H2.7 37.49,3.27 32.61,8.15 U2.2
P1.7: length 15.7
  Top Layer w0.254: U2.3 33.41,8.62 37.34,4.69 38.48,4.69 40.03,3.14 H2.8
P2.0: length 35.5
  Top Layer w0.254: U2.18 43.85,20.35 46.74,23.24 46.74,26.41 47.62,27.3 60.21,27.3 C10.2 61.61,29.57 60.7,30.48 P20.1 60.7,34.67 60.2,35.17 60.2,38.15 H1.16
P2.1: length 31.6
  Top Layer w0.254: H1.15 57.84,38.03 57.84,36.75 57.66,36.57 54.99,36.57 53.21,34.79 53.21,32.89 P21.1 53.21,30.61 54.12,29.7 C9.2 47.12,28.57 46.23,27.68 46.23,23.49 43.89,21.15 U2.19
P2.2: length 23.3
  Top Layer w0.254: U2.20 43.93,21.95 45.21,23.24 45.21,27.94 55.15,37.87 H1.14
P2.3: length 21.4
  Top Layer w0.254: U2.21 43.84,22.75 43.94,22.86 43.94,27.94 52.61,36.6 H1.13
P2.4: length 20.1
  Top Layer w0.254: H1.12 50.07,35.71 41.4,27.05 41.4,25.27 40.15,24.01 40.15,23.65 40.31,23.49 41.36,23.49 41.42,23.55 U2.22
P2.5: length 16.1
  Top Layer w0.254: H1.11 46.23,36.88 46.23,33.27 39.81,26.86 U2.23
P2.6: length 15.5
  Top Layer w0.254: U2.24 39.12,25.39 39.12,27.68 45.09,33.65 45.09,38.09 H1.10
P2.7: length 14.6
  Top Layer w0.254: H1.9 42.29,38.03 42.29,32.13 38.21,28.05 U2.25
P3.6/WR#: length 26.6
  Top Layer w0.254: H2.15 57.81,5.68 56.64,6.85 48.01,6.85 45.47,9.39 45.47,11.17 42.8,13.84 42.8,15.49 42.74,15.55 U2.12
P3.7/RD#: length 29.3
  Top Layer w0.254: H2.16 60.23,1.61 60.23,4.28 56.9,7.62 48.01,7.62 46.53,9.09 46.53,11.88 46.35,12.06 45.47,12.06 43.31,14.22 43.31,16.12 43.08,16.35 U2.13
P4.0: length 43.9
  Top Layer w0.254: H3.1 61.42,7.69 59.87,7.69 59.69,7.87 59.69,26.67 59.51,26.84 48.44,26.84 48.26,26.67 48.26,23.49 45.06,20.29 44.58,20.29 43.85,19.55 U2.17
P4.1: length 39.8
  Top Layer w0.254: U2.28 v2(35.81,22.6)
  Bottom Layer w0.254: H3.2 61.47,10.41 59.93,8.87 59.74,8.87 59.58,8.71 59.58,8.52 57.66,6.6 46.61,6.6 44.96,8.25 44.96,10.28 41.66,13.58 41.66,16.76 v2(35.81,22.6)
P4.2/INT3#: length 53.8
  Top Layer w0.254: 30.08,19.55 v2(32.64,19.55) ; H3.3 64.52,10.03 64.52,5.7 v2(62.88,4.06)
  Bottom Layer w0.254: v2(62.88,4.06) 62.87,4.06 62.36,4.57 41.15,4.57 34.67,11.04 34.67,17.52 v2(32.64,19.55)
P4.3/INT2#: length 43
  Top Layer w0.254: U2.6 v2(35.81,11.17)
  Bottom Layer w0.254: H3.4 63.37,13.71 63.37,5.84 63.12,5.58 41.4,5.58 v2(35.81,11.17)
PSEN#/P4.4: length 39.3
  Top Layer w0.254: U2.26 37.41,22.8 v2(37.34,22.73)
  Bottom Layer w0.254: H3.5 61.47,17.9 61.11,17.9 60.07,18.94 60.07,28.06 59.31,28.82 47.12,28.82 41.02,22.73 v2(37.34,22.73)
RST: length 48.5
  Top Layer w0.254: v2(13.33,19.93) 13.08,20.19 SW2.1 13.71,22.6 v2(19.3,22.6) ; R4.2 17.27,6.86 16.76,7.36 16.76,12.81 C8.1 17.54,14.33 v2(16.13,15.74) ; U2.4 34.21,16.45 v2(32.77,17.9)
  Bottom Layer w0.254: v2(19.3,22.6) 24.89,22.6 29.59,17.9 v2(32.77,17.9) ; v2(13.33,19.93) 16.13,17.14 v2(16.13,15.74)
RXD/P3.0: length 47.4
  Top Layer w0.254: H2.9 42.57,5.15 42.39,5.33 40,5.33 35.01,10.32 U2.5 ; v2(23.29,4.24) 17.4,4.24 17.22,4.06 17.22,2.59 H6.1
  Bottom Layer w0.254: v2(23.29,4.24) 24.24,3.3 42.42,3.3 42.57,3.14 H2.9
T0/P3.4: length 23.5
  Top Layer w0.254: U2.10 39.01,12.29 39.75,11.55 43.43,11.55 44.32,10.66 44.32,8.89 47.5,5.71 52.83,5.71 53.01,5.53 53.01,1.76 H2.13
T1/P3.5: length 25.3
  Top Layer w0.254: U2.11 39.88,13.75 39.88,12.44 40.06,12.26 43.61,12.26 44.83,11.04 44.83,9.27 47.88,6.22 55.25,6.22 55.42,6.04 55.42,1.63 H2.14
T2/P1.0: length 27.6
  Top Layer w0.254: 30.08,18.75 v2(27.22,18.75) 24.64,21.33 24.27,21.33 LED2.1
  Bottom Layer w0.254: H2.1 21.97,1.76 21.97,4.95 23.62,6.6 23.62,16.12 26.25,18.75 v2(27.22,18.75)
TXD/P3.1: length 53.4
  Top Layer w0.254: H2.10 44.96,1.64 44.96,5.33 42.34,7.94 42.34,9.21 42.16,9.39 38.99,9.39 36.61,11.77 U2.7 ; H6.2 13.59,2.28 16.51,5.2 v2(23.88,5.2)
  Bottom Layer w0.254: H2.10 45.11,2.51 43.69,3.93 25.15,3.93 v2(23.88,5.2)
XTAL1: length 14.5
  Top Layer w0.254: U3.2 53.97,21.77 53.72,21.77 50.89,18.93 49.15,18.93 C6.2 48.91,19.17 48.39,19.17 47.17,17.95 U2.15
XTAL2: length 14.3
  Top Layer w0.254: U2.14 47.69,17.15 C7.2 49.15,15.7 50.59,15.7 53.52,12.77 53.72,12.77 U3.1
$1N266: length 20.5
  Top Layer w0.254: USB1.B5 4.71,15.62 4.32,15.23 4.32,11.3 4.76,10.85 8.38,10.85 8.56,11.03 v2(8.56,12.57) ; v2(14.35,10.92) 14.35,12.53 R1.1
  Bottom Layer w0.254: v2(14.35,10.92) 10.21,10.92 v2(8.56,12.57)
$1N271: length 17.3
  Top Layer w0.254: R2.1 11.18,12.11 9.35,10.28 4.44,10.28 3.65,11.08 3.65,16.51 3.77,16.62 USB1.A5
$1N1197: length 3.4
  Top Layer w0.254: LED1.1 13.76,35.85 R3.1
$1N4768: length 2.4
  Top Layer w0.254: LED2.2 21.55,21.08 R5.1
$1N4814: length 2.3
  Top Layer w0.254: LED3.2 21.58,18 R6.1

## Copper pours and planes (outline as drawn; the poured copper is in the pictures)
GND on Top Layer: -12.19,45.72 79.25,45.72 79.25,-6.74 -12.19,-6.74
GND on Bottom Layer: -13.72,46.98 82.68,46.98 82.68,-10.04 -13.72,-10.04

Small or netless copper shapes (teardrops, artwork), in the pictures only: 306 on Top Layer, 82 on Bottom Layer

## Text on the board
Top Silkscreen Layer: P46 | P45 | P44 | P43 | P42 | P41 | P40 | GND | 3.3 | 5V | +5V | TX | RX | P00 | P10 | P01 | P11 | P02 | P12 | P03 | P13 | P04 | P14 | P05 | P15 | P06 | P16 | P07 | P17 | P27 | P30 | P26 | P31 | P25 | P32 | P24 | P33 | P23 | P34 | P22 | P35 | P21 | P36 | P20 | P37 | R1 | POWER | RESET | STC89C52RC
